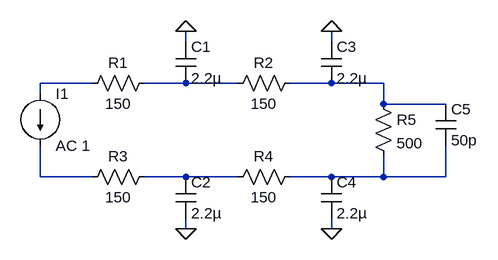
[diagram p0: schematic filtro_amb_conRC.asc]
filtro_amb_conRC.asc, the LTspice schematic file:
Version 4.1
SHEET 1 1236 680
WIRE 96 48 96 32
WIRE 320 48 320 32
WIRE -48 112 -128 112
WIRE 96 112 32 112
WIRE 176 112 96 112
WIRE 320 112 256 112
WIRE 400 112 320 112
WIRE -128 128 -128 112
WIRE 400 144 400 112
WIRE 496 144 400 144
WIRE -128 256 -128 208
WIRE -48 256 -128 256
WIRE 96 256 32 256
WIRE 176 256 96 256
WIRE 320 256 256 256
WIRE 400 256 400 224
WIRE 400 256 320 256
WIRE 496 256 496 208
WIRE 496 256 400 256
WIRE 96 336 96 320
WIRE 320 336 320 320
FLAG 96 32 0
FLAG 320 32 0
FLAG 96 336 0
FLAG 320 336 0
SYMBOL res 48 96 R90
WINDOW 0 0 56 VBottom 2
WINDOW 3 32 56 VTop 2
SYMATTR InstName R1
SYMATTR Value 150
SYMBOL res 272 96 R90
WINDOW 0 0 56 VBottom 2
WINDOW 3 32 56 VTop 2
SYMATTR InstName R2
SYMATTR Value 150
SYMBOL res 48 240 R90
WINDOW 0 0 56 VBottom 2
WINDOW 3 32 56 VTop 2
SYMATTR InstName R3
SYMATTR Value 150
SYMBOL res 272 240 R90
WINDOW 0 0 56 VBottom 2
WINDOW 3 32 56 VTop 2
SYMATTR InstName R4
SYMATTR Value 150
SYMBOL cap 80 48 R0
SYMATTR InstName C1
SYMATTR Value 2.2µ
SYMBOL cap 80 256 R0
SYMATTR InstName C2
SYMATTR Value 2.2µ
SYMBOL cap 304 48 R0
SYMATTR InstName C3
SYMATTR Value 2.2µ
SYMBOL cap 304 256 R0
SYMATTR InstName C4
SYMATTR Value 2.2µ
SYMBOL res 384 128 R0
SYMATTR InstName R5
SYMATTR Value 500
SYMBOL cap 480 144 R0
SYMATTR InstName C5
SYMATTR Value 50p
SYMBOL current -128 128 R0
WINDOW 123 0 0 Left 0
WINDOW 39 0 0 Left 0
SYMATTR InstName I1
SYMATTR Value AC 1

The netlist it stands for:
* filtro_amb_conRC.asc
R1 N002 N001 150
R2 N003 N002 150
R3 N005 N004 150
R4 N006 N005 150
C1 0 N002 2.2µ
C2 N005 0 2.2µ
C3 0 N003 2.2µ
C4 N006 0 2.2µ
R5 N003 N006 500
C5 N003 N006 50p
I1 N001 N004 AC 1
.backanno
.end